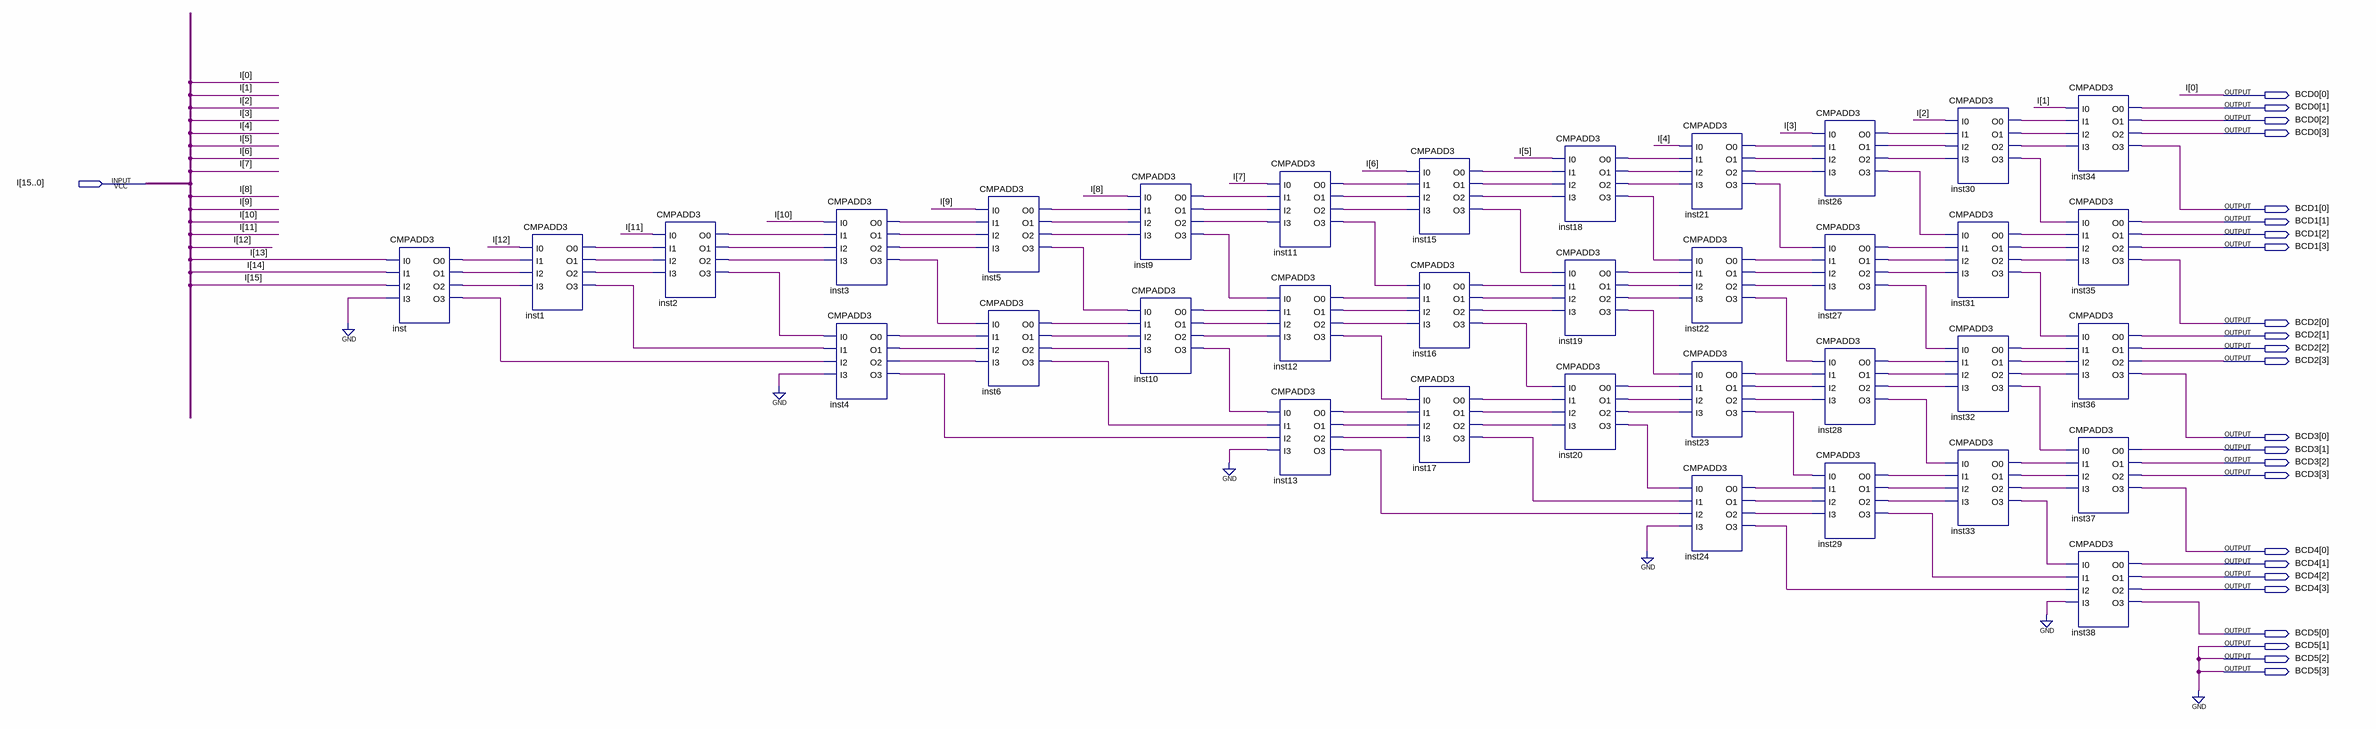
[diagram p0: schematic sheet]
// Quartus schematic DOUBLEDABBLE16BIT.bdf as structural Verilog: 35 symbols, 25 pins
module DOUBLEDABBLE16BIT (
  input  [15:0] I,
  output [3:0] BCD0,
  output [3:0] BCD1,
  output [3:0] BCD2,
  output [3:0] BCD3,
  output [3:0] BCD4,
  output [3:0] BCD5
);

  wire inst1_o0, inst1_o1, inst1_o2, inst1_o3, inst2_o0, inst2_o1, inst2_o2, inst2_o3, inst3_o0, inst3_o1,
       inst3_o2, inst3_o3, inst4_o0, inst4_o1, inst4_o2, inst4_o3, inst5_o0, inst5_o1, inst5_o2, inst5_o3,
       inst6_o0, inst6_o1, inst6_o2, inst6_o3, inst9_o0, inst9_o1, inst9_o2, inst9_o3, inst10_o0, inst10_o1,
       inst10_o2, inst10_o3, inst11_o0, inst11_o1, inst11_o2, inst11_o3, inst12_o0, inst12_o1, inst12_o2,
       inst12_o3, inst13_o0, inst13_o1, inst13_o2, inst13_o3, inst15_o0, inst15_o1, inst15_o2, inst15_o3,
       inst16_o0, inst16_o1, inst16_o2, inst16_o3, inst17_o0, inst17_o1, inst17_o2, inst17_o3, inst18_o0,
       inst18_o1, inst18_o2, inst18_o3, inst19_o0, inst19_o1, inst19_o2, inst19_o3, inst20_o0, inst20_o1,
       inst20_o2, inst20_o3, inst21_o0, inst21_o1, inst21_o2, inst21_o3, inst22_o0, inst22_o1, inst22_o2,
       inst22_o3, inst23_o0, inst23_o1, inst23_o2, inst23_o3, inst24_o0, inst24_o1, inst24_o2, inst24_o3,
       inst26_o0, inst26_o1, inst26_o2, inst26_o3, inst27_o0, inst27_o1, inst27_o2, inst27_o3, inst28_o0,
       inst28_o1, inst28_o2, inst28_o3, inst29_o0, inst29_o1, inst29_o2, inst29_o3, inst30_o0, inst30_o1,
       inst30_o2, inst30_o3, inst31_o0, inst31_o1, inst31_o2, inst31_o3, inst32_o0, inst32_o1, inst32_o2,
       inst32_o3, inst33_o0, inst33_o1, inst33_o2, inst33_o3, inst_o0, inst_o1, inst_o2, inst_o3;

  CMPADD3 inst (.I0(I[13]), .I1(I[14]), .I2(I[15]), .I3(1'b0), .O0(inst_o0), .O1(inst_o1), .O2(inst_o2), .O3(inst_o3));
  CMPADD3 inst1 (
    .I0(I[12]), .I1(inst_o0), .I2(inst_o1), .I3(inst_o2), .O0(inst1_o0), .O1(inst1_o1), .O2(inst1_o2),
    .O3(inst1_o3));
  CMPADD3 inst2 (
    .I0(I[11]), .I1(inst1_o0), .I2(inst1_o1), .I3(inst1_o2), .O0(inst2_o0), .O1(inst2_o1), .O2(inst2_o2),
    .O3(inst2_o3));
  CMPADD3 inst3 (
    .I0(I[10]), .I1(inst2_o0), .I2(inst2_o1), .I3(inst2_o2), .O0(inst3_o0), .O1(inst3_o1), .O2(inst3_o2),
    .O3(inst3_o3));
  CMPADD3 inst4 (
    .I0(inst2_o3), .I1(inst1_o3), .I2(inst_o3), .I3(1'b0), .O0(inst4_o0), .O1(inst4_o1), .O2(inst4_o2),
    .O3(inst4_o3));
  CMPADD3 inst5 (
    .I0(I[9]), .I1(inst3_o0), .I2(inst3_o1), .I3(inst3_o2), .O0(inst5_o0), .O1(inst5_o1), .O2(inst5_o2),
    .O3(inst5_o3));
  CMPADD3 inst6 (
    .I0(inst3_o3), .I1(inst4_o0), .I2(inst4_o1), .I3(inst4_o2), .O0(inst6_o0), .O1(inst6_o1), .O2(inst6_o2),
    .O3(inst6_o3));
  CMPADD3 inst9 (
    .I0(I[8]), .I1(inst5_o0), .I2(inst5_o1), .I3(inst5_o2), .O0(inst9_o0), .O1(inst9_o1), .O2(inst9_o2),
    .O3(inst9_o3));
  CMPADD3 inst10 (
    .I0(inst5_o3), .I1(inst6_o0), .I2(inst6_o1), .I3(inst6_o2), .O0(inst10_o0), .O1(inst10_o1),
    .O2(inst10_o2), .O3(inst10_o3));
  CMPADD3 inst11 (
    .I0(I[7]), .I1(inst9_o0), .I2(inst9_o1), .I3(inst9_o2), .O0(inst11_o0), .O1(inst11_o1), .O2(inst11_o2),
    .O3(inst11_o3));
  CMPADD3 inst12 (
    .I0(inst9_o3), .I1(inst10_o0), .I2(inst10_o1), .I3(inst10_o2), .O0(inst12_o0), .O1(inst12_o1),
    .O2(inst12_o2), .O3(inst12_o3));
  CMPADD3 inst13 (
    .I0(inst10_o3), .I1(inst6_o3), .I2(inst4_o3), .I3(1'b0), .O0(inst13_o0), .O1(inst13_o1), .O2(inst13_o2),
    .O3(inst13_o3));
  CMPADD3 inst15 (
    .I0(I[6]), .I1(inst11_o0), .I2(inst11_o1), .I3(inst11_o2), .O0(inst15_o0), .O1(inst15_o1),
    .O2(inst15_o2), .O3(inst15_o3));
  CMPADD3 inst16 (
    .I0(inst11_o3), .I1(inst12_o0), .I2(inst12_o1), .I3(inst12_o2), .O0(inst16_o0), .O1(inst16_o1),
    .O2(inst16_o2), .O3(inst16_o3));
  CMPADD3 inst17 (
    .I0(inst12_o3), .I1(inst13_o0), .I2(inst13_o1), .I3(inst13_o2), .O0(inst17_o0), .O1(inst17_o1),
    .O2(inst17_o2), .O3(inst17_o3));
  CMPADD3 inst18 (
    .I0(I[5]), .I1(inst15_o0), .I2(inst15_o1), .I3(inst15_o2), .O0(inst18_o0), .O1(inst18_o1),
    .O2(inst18_o2), .O3(inst18_o3));
  CMPADD3 inst19 (
    .I0(inst15_o3), .I1(inst16_o0), .I2(inst16_o1), .I3(inst16_o2), .O0(inst19_o0), .O1(inst19_o1),
    .O2(inst19_o2), .O3(inst19_o3));
  CMPADD3 inst20 (
    .I0(inst16_o3), .I1(inst17_o0), .I2(inst17_o1), .I3(inst17_o2), .O0(inst20_o0), .O1(inst20_o1),
    .O2(inst20_o2), .O3(inst20_o3));
  CMPADD3 inst21 (
    .I0(I[4]), .I1(inst18_o0), .I2(inst18_o1), .I3(inst18_o2), .O0(inst21_o0), .O1(inst21_o1),
    .O2(inst21_o2), .O3(inst21_o3));
  CMPADD3 inst22 (
    .I0(inst18_o3), .I1(inst19_o0), .I2(inst19_o1), .I3(inst19_o2), .O0(inst22_o0), .O1(inst22_o1),
    .O2(inst22_o2), .O3(inst22_o3));
  CMPADD3 inst23 (
    .I0(inst19_o3), .I1(inst20_o0), .I2(inst20_o1), .I3(inst20_o2), .O0(inst23_o0), .O1(inst23_o1),
    .O2(inst23_o2), .O3(inst23_o3));
  CMPADD3 inst24 (
    .I0(inst20_o3), .I1(inst17_o3), .I2(inst13_o3), .I3(1'b0), .O0(inst24_o0), .O1(inst24_o1),
    .O2(inst24_o2), .O3(inst24_o3));
  CMPADD3 inst26 (
    .I0(I[3]), .I1(inst21_o0), .I2(inst21_o1), .I3(inst21_o2), .O0(inst26_o0), .O1(inst26_o1),
    .O2(inst26_o2), .O3(inst26_o3));
  CMPADD3 inst27 (
    .I0(inst21_o3), .I1(inst22_o0), .I2(inst22_o1), .I3(inst22_o2), .O0(inst27_o0), .O1(inst27_o1),
    .O2(inst27_o2), .O3(inst27_o3));
  CMPADD3 inst28 (
    .I0(inst22_o3), .I1(inst23_o0), .I2(inst23_o1), .I3(inst23_o2), .O0(inst28_o0), .O1(inst28_o1),
    .O2(inst28_o2), .O3(inst28_o3));
  CMPADD3 inst29 (
    .I0(inst23_o3), .I1(inst24_o0), .I2(inst24_o1), .I3(inst24_o2), .O0(inst29_o0), .O1(inst29_o1),
    .O2(inst29_o2), .O3(inst29_o3));
  CMPADD3 inst30 (
    .I0(I[2]), .I1(inst26_o0), .I2(inst26_o1), .I3(inst26_o2), .O0(inst30_o0), .O1(inst30_o1),
    .O2(inst30_o2), .O3(inst30_o3));
  CMPADD3 inst31 (
    .I0(inst26_o3), .I1(inst27_o0), .I2(inst27_o1), .I3(inst27_o2), .O0(inst31_o0), .O1(inst31_o1),
    .O2(inst31_o2), .O3(inst31_o3));
  CMPADD3 inst32 (
    .I0(inst27_o3), .I1(inst28_o0), .I2(inst28_o1), .I3(inst28_o2), .O0(inst32_o0), .O1(inst32_o1),
    .O2(inst32_o2), .O3(inst32_o3));
  CMPADD3 inst33 (
    .I0(inst28_o3), .I1(inst29_o0), .I2(inst29_o1), .I3(inst29_o2), .O0(inst33_o0), .O1(inst33_o1),
    .O2(inst33_o2), .O3(inst33_o3));
  CMPADD3 inst34 (
    .I0(I[1]), .I1(inst30_o0), .I2(inst30_o1), .I3(inst30_o2), .O0(BCD0[1]), .O1(BCD0[2]), .O2(BCD0[3]),
    .O3(BCD1[0]));
  CMPADD3 inst35 (
    .I0(inst30_o3), .I1(inst31_o0), .I2(inst31_o1), .I3(inst31_o2), .O0(BCD1[1]), .O1(BCD1[2]), .O2(BCD1[3]),
    .O3(BCD2[0]));
  CMPADD3 inst36 (
    .I0(inst31_o3), .I1(inst32_o0), .I2(inst32_o1), .I3(inst32_o2), .O0(BCD2[1]), .O1(BCD2[2]), .O2(BCD2[3]),
    .O3(BCD3[0]));
  CMPADD3 inst37 (
    .I0(inst32_o3), .I1(inst33_o0), .I2(inst33_o1), .I3(inst33_o2), .O0(BCD3[1]), .O1(BCD3[2]), .O2(BCD3[3]),
    .O3(BCD4[0]));
  CMPADD3 inst38 (
    .I0(inst33_o3), .I1(inst29_o3), .I2(inst24_o3), .I3(1'b0), .O0(BCD4[1]), .O1(BCD4[2]), .O2(BCD4[3]),
    .O3(BCD5[0]));

  assign BCD0[0] = I[0];
  assign BCD5[3:1] = 3'b000;
endmodule
